# Altium schematic sheet ModuMIDI_LEDs.SchDoc
size A; SheetNumber: 2; SheetTotal: 3
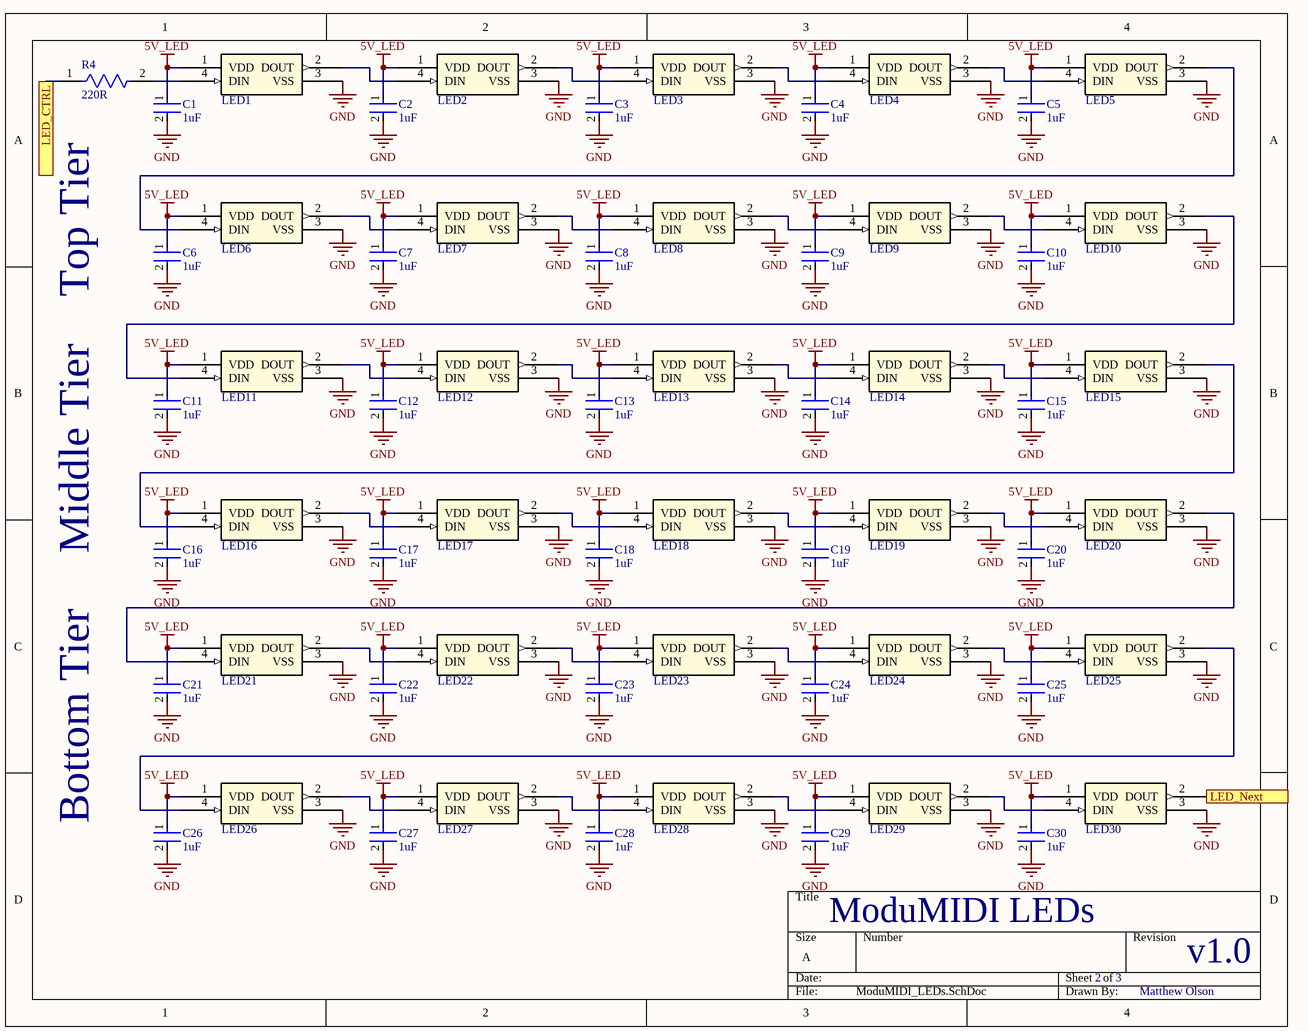
[diagram p0: ModuMIDI_LEDs.SchDoc]

## Parts
C1  1uF  [FP-CC0805-0_85-MFG]
C2  1uF  [FP-CC0805-0_85-MFG]
C3  1uF  [FP-CC0805-0_85-MFG]
C4  1uF  [FP-CC0805-0_85-MFG]
C5  1uF  [FP-CC0805-0_85-MFG]
C6  1uF  [FP-CC0805-0_85-MFG]
C7  1uF  [FP-CC0805-0_85-MFG]
C8  1uF  [FP-CC0805-0_85-MFG]
C9  1uF  [FP-CC0805-0_85-MFG]
C10  1uF  [FP-CC0805-0_85-MFG]
C11  1uF  [FP-CC0805-0_85-MFG]
C12  1uF  [FP-CC0805-0_85-MFG]
C13  1uF  [FP-CC0805-0_85-MFG]
C14  1uF  [FP-CC0805-0_85-MFG]
C15  1uF  [FP-CC0805-0_85-MFG]
C16  1uF  [FP-CC0805-0_85-MFG]
C17  1uF  [FP-CC0805-0_85-MFG]
C18  1uF  [FP-CC0805-0_85-MFG]
C19  1uF  [FP-CC0805-0_85-MFG]
C20  1uF  [FP-CC0805-0_85-MFG]
C21  1uF  [FP-CC0805-0_85-MFG]
C22  1uF  [FP-CC0805-0_85-MFG]
C23  1uF  [FP-CC0805-0_85-MFG]
C24  1uF  [FP-CC0805-0_85-MFG]
C25  1uF  [FP-CC0805-0_85-MFG]
C26  1uF  [FP-CC0805-0_85-MFG]
C27  1uF  [FP-CC0805-0_85-MFG]
C28  1uF  [FP-CC0805-0_85-MFG]
C29  1uF  [FP-CC0805-0_85-MFG]
C30  1uF  [FP-CC0805-0_85-MFG]
LED1  IN-PI55TATPRPGPB  [LED_IN-PI55TAT_INL]  (value not drawn)
LED2  IN-PI55TATPRPGPB  [LED_IN-PI55TAT_INL]  (value not drawn)
LED3  IN-PI55TATPRPGPB  [LED_IN-PI55TAT_INL]  (value not drawn)
LED4  IN-PI55TATPRPGPB  [LED_IN-PI55TAT_INL]  (value not drawn)
LED5  IN-PI55TATPRPGPB  [LED_IN-PI55TAT_INL]  (value not drawn)
LED6  IN-PI55TATPRPGPB  [LED_IN-PI55TAT_INL]  (value not drawn)
LED7  IN-PI55TATPRPGPB  [LED_IN-PI55TAT_INL]  (value not drawn)
LED8  IN-PI55TATPRPGPB  [LED_IN-PI55TAT_INL]  (value not drawn)
LED9  IN-PI55TATPRPGPB  [LED_IN-PI55TAT_INL]  (value not drawn)
LED10  IN-PI55TATPRPGPB  [LED_IN-PI55TAT_INL]  (value not drawn)
LED11  IN-PI55TATPRPGPB  [LED_IN-PI55TAT_INL]  (value not drawn)
LED12  IN-PI55TATPRPGPB  [LED_IN-PI55TAT_INL]  (value not drawn)
LED13  IN-PI55TATPRPGPB  [LED_IN-PI55TAT_INL]  (value not drawn)
LED14  IN-PI55TATPRPGPB  [LED_IN-PI55TAT_INL]  (value not drawn)
LED15  IN-PI55TATPRPGPB  [LED_IN-PI55TAT_INL]  (value not drawn)
LED16  IN-PI55TATPRPGPB  [LED_IN-PI55TAT_INL]  (value not drawn)
LED17  IN-PI55TATPRPGPB  [LED_IN-PI55TAT_INL]  (value not drawn)
LED18  IN-PI55TATPRPGPB  [LED_IN-PI55TAT_INL]  (value not drawn)
LED19  IN-PI55TATPRPGPB  [LED_IN-PI55TAT_INL]  (value not drawn)
LED20  IN-PI55TATPRPGPB  [LED_IN-PI55TAT_INL]  (value not drawn)
LED21  IN-PI55TATPRPGPB  [LED_IN-PI55TAT_INL]  (value not drawn)
LED22  IN-PI55TATPRPGPB  [LED_IN-PI55TAT_INL]  (value not drawn)
LED23  IN-PI55TATPRPGPB  [LED_IN-PI55TAT_INL]  (value not drawn)
LED24  IN-PI55TATPRPGPB  [LED_IN-PI55TAT_INL]  (value not drawn)
LED25  IN-PI55TATPRPGPB  [LED_IN-PI55TAT_INL]  (value not drawn)
LED26  IN-PI55TATPRPGPB  [LED_IN-PI55TAT_INL]  (value not drawn)
LED27  IN-PI55TATPRPGPB  [LED_IN-PI55TAT_INL]  (value not drawn)
LED28  IN-PI55TATPRPGPB  [LED_IN-PI55TAT_INL]  (value not drawn)
LED29  IN-PI55TATPRPGPB  [LED_IN-PI55TAT_INL]  (value not drawn)
LED30  IN-PI55TATPRPGPB  [LED_IN-PI55TAT_INL]  (value not drawn)
R4  220R  [FP-CRCW0805-e3-MFG]

## Ports
LED_CTRL, LED_Next (out)

## Nets
5V_LED: C1.1 C2.1 C3.1 C4.1 C5.1 C6.1 C7.1 C8.1 C9.1 C10.1 C11.1 C12.1 C13.1 C14.1 C15.1 C16.1 C17.1 C18.1 C19.1 C20.1 C21.1 C22.1 C23.1 C24.1 C25.1 C26.1 C27.1 C28.1 C29.1 C30.1 LED1.1(VDD) LED2.1(VDD) LED3.1(VDD) LED4.1(VDD) LED5.1(VDD) LED6.1(VDD) LED7.1(VDD) LED8.1(VDD) LED9.1(VDD) LED10.1(VDD) LED11.1(VDD) LED12.1(VDD) LED13.1(VDD) LED14.1(VDD) LED15.1(VDD) LED16.1(VDD) LED17.1(VDD) LED18.1(VDD) LED19.1(VDD) LED20.1(VDD) LED21.1(VDD) LED22.1(VDD) LED23.1(VDD) LED24.1(VDD) LED25.1(VDD) LED26.1(VDD) LED27.1(VDD) LED28.1(VDD) LED29.1(VDD) LED30.1(VDD)
GND: C1.2 C2.2 C3.2 C4.2 C5.2 C6.2 C7.2 C8.2 C9.2 C10.2 C11.2 C12.2 C13.2 C14.2 C15.2 C16.2 C17.2 C18.2 C19.2 C20.2 C21.2 C22.2 C23.2 C24.2 C25.2 C26.2 C27.2 C28.2 C29.2 C30.2 LED1.3(VSS) LED2.3(VSS) LED3.3(VSS) LED4.3(VSS) LED5.3(VSS) LED6.3(VSS) LED7.3(VSS) LED8.3(VSS) LED9.3(VSS) LED10.3(VSS) LED11.3(VSS) LED12.3(VSS) LED13.3(VSS) LED14.3(VSS) LED15.3(VSS) LED16.3(VSS) LED17.3(VSS) LED18.3(VSS) LED19.3(VSS) LED20.3(VSS) LED21.3(VSS) LED22.3(VSS) LED23.3(VSS) LED24.3(VSS) LED25.3(VSS) LED26.3(VSS) LED27.3(VSS) LED28.3(VSS) LED29.3(VSS) LED30.3(VSS)
LED_CTRL: R4.1 ; port LED_CTRL
LED_Next: LED30.2(DOUT) ; port LED_Next
NetLED1_2: LED1.2(DOUT) LED2.4(DIN)
NetLED1_4: LED1.4(DIN) R4.2
NetLED2_2: LED2.2(DOUT) LED3.4(DIN)
NetLED3_2: LED3.2(DOUT) LED4.4(DIN)
NetLED4_2: LED4.2(DOUT) LED5.4(DIN)
NetLED5_2: LED5.2(DOUT) LED6.4(DIN)
NetLED6_2: LED6.2(DOUT) LED7.4(DIN)
NetLED7_2: LED7.2(DOUT) LED8.4(DIN)
NetLED8_2: LED8.2(DOUT) LED9.4(DIN)
NetLED9_2: LED9.2(DOUT) LED10.4(DIN)
NetLED10_2: LED10.2(DOUT) LED11.4(DIN)
NetLED11_2: LED11.2(DOUT) LED12.4(DIN)
NetLED12_2: LED12.2(DOUT) LED13.4(DIN)
NetLED13_2: LED13.2(DOUT) LED14.4(DIN)
NetLED14_2: LED14.2(DOUT) LED15.4(DIN)
NetLED15_2: LED15.2(DOUT) LED16.4(DIN)
NetLED16_2: LED16.2(DOUT) LED17.4(DIN)
NetLED17_2: LED17.2(DOUT) LED18.4(DIN)
NetLED18_2: LED18.2(DOUT) LED19.4(DIN)
NetLED19_2: LED19.2(DOUT) LED20.4(DIN)
NetLED20_2: LED20.2(DOUT) LED21.4(DIN)
NetLED21_2: LED21.2(DOUT) LED22.4(DIN)
NetLED22_2: LED22.2(DOUT) LED23.4(DIN)
NetLED23_2: LED23.2(DOUT) LED24.4(DIN)
NetLED24_2: LED24.2(DOUT) LED25.4(DIN)
NetLED25_2: LED25.2(DOUT) LED26.4(DIN)
NetLED26_2: LED26.2(DOUT) LED27.4(DIN)
NetLED27_2: LED27.2(DOUT) LED28.4(DIN)
NetLED28_2: LED28.2(DOUT) LED29.4(DIN)
NetLED29_2: LED29.2(DOUT) LED30.4(DIN)

## Notes on the sheet
- (near R4) Top Tier
- Middle Tier
- Bottom Tier
- ModuMIDI LEDs
- 2
- 3
- v1.0
- Matthew Olson

## Library data of the parts
C1-C30 = CMP-03422-000182-1: CAP CER 1UF 10V X7R 0805; Manufacturer: Yageo; Manufacturer Part Number: CC0805KKX7R6BB105; Material: Ceramic; Tolerance: 0.1; Value: 1 uF; ComponentLink2URL: http://www.yageo.com/documents/recent/UPY-GPHC_Y5V_6.3V-to-50V_8.pdf; Automotive: No; Temperature Range Low: -30°C; Octopart: https://octopart.com/cc0805kkx7r6bb105-yageo-42522859; Temperature Characteristic: X7R; RoHS: TRUE; Voltage Rating: 10 V; Capacitance: 1 uF; Package: CC0805-0.85; Device Class L3: Ceramic Capacitors; Category: Cap; Mouser Description: Multilayer Ceramic Capacitors MLCC - SMD/SMT 1.0uF 10V X7R 10%; Temperature Range High: +85°C; Ipc Land Pattern Name: CAPC200125X85; ComponentLink2Description: Datasheet; Temperature: -30°C to +85°C; Height: 0.95mm; Lead Free: Yes; Device Class L1: Passive Components; Device Class L2: Capacitors; Footprint Url: http://www.yageo.com/exep/pages/download/literatures/UPY-C_GEN_24.pdf; Digikey Description: CAP CER 1UF 10V X7R 0805; PN: CC0805KKX7R6BB105
LED1-LED30 = IN-PI55TATPRPGPB: No Description Available; Mfr_Name: Inolux; RefDes: RefDes; Type: Type; PN: IN-PI55TATPRPGPB
R4 = CMP-2001-03682-2: RES Thick Film, 220Ω, 1%, 0.125W, 100ppm/°C, 0805; Max Power Dissipation: 125mW; Voltage Rating: 150V; PN: CRCW0805220RFKEA; Packaging: Tape and Reel; Termination: SMD/SMT; Height: 0.45mm; Package Quantity: 10; Width: 0.049inch; Min Operating Temperature: -55°C; Lead Free: Lead Free; Military Standard: Not; Mount: Surface Mount; Max Operating Temperature: 155°C; Voltage Rating (DC): 150V; Resistance: 220R; Composition: Thick Film; Case/Package: 0805; Length: 2mm; Weight: 0.000194oz; Case Code (Metric): 2012; Number of Terminations: 2; Case Code (Imperial): 0805; Radiation Hardening: No; Tolerance: 1%; Features: Automotive AEC-Q200; Power Rating: 125mW; Depth: 1.25mm; Contact Plating: Tin; Temperature Coefficient: 100ppm/°C